# EasyEDA Pro project C8T6v1.eprj, board PCB3
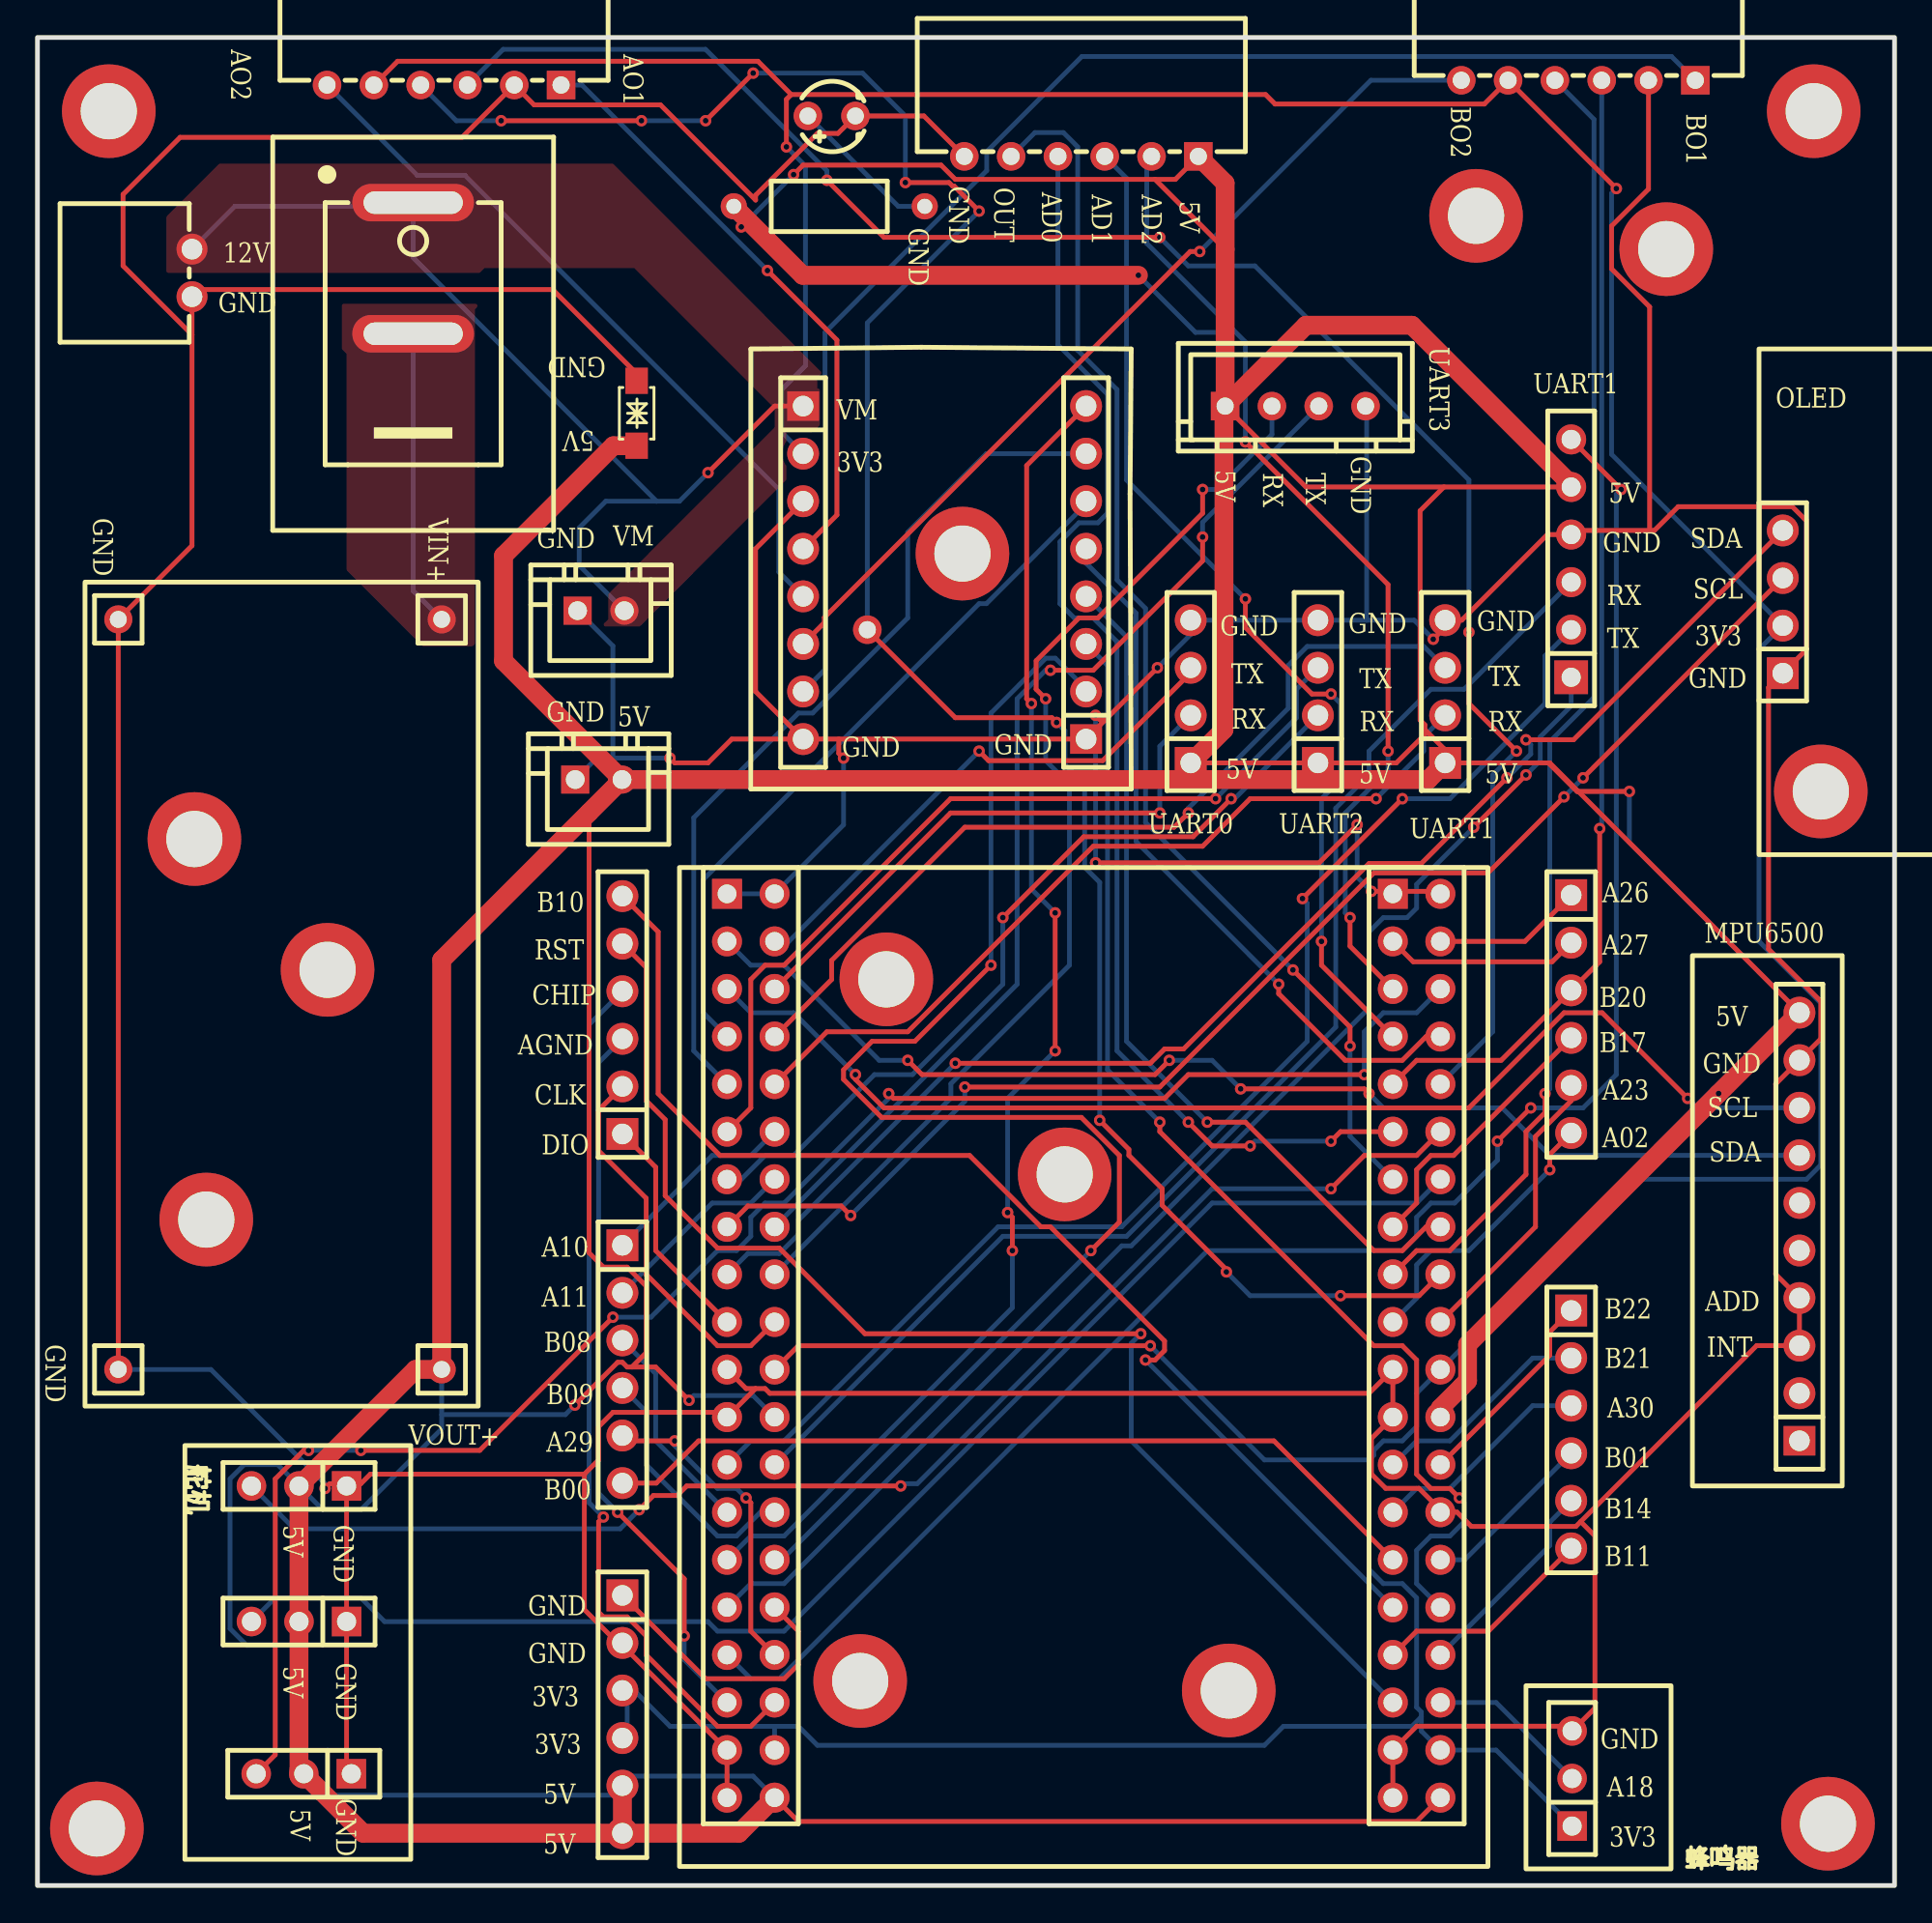
[diagram p6: board, top side]
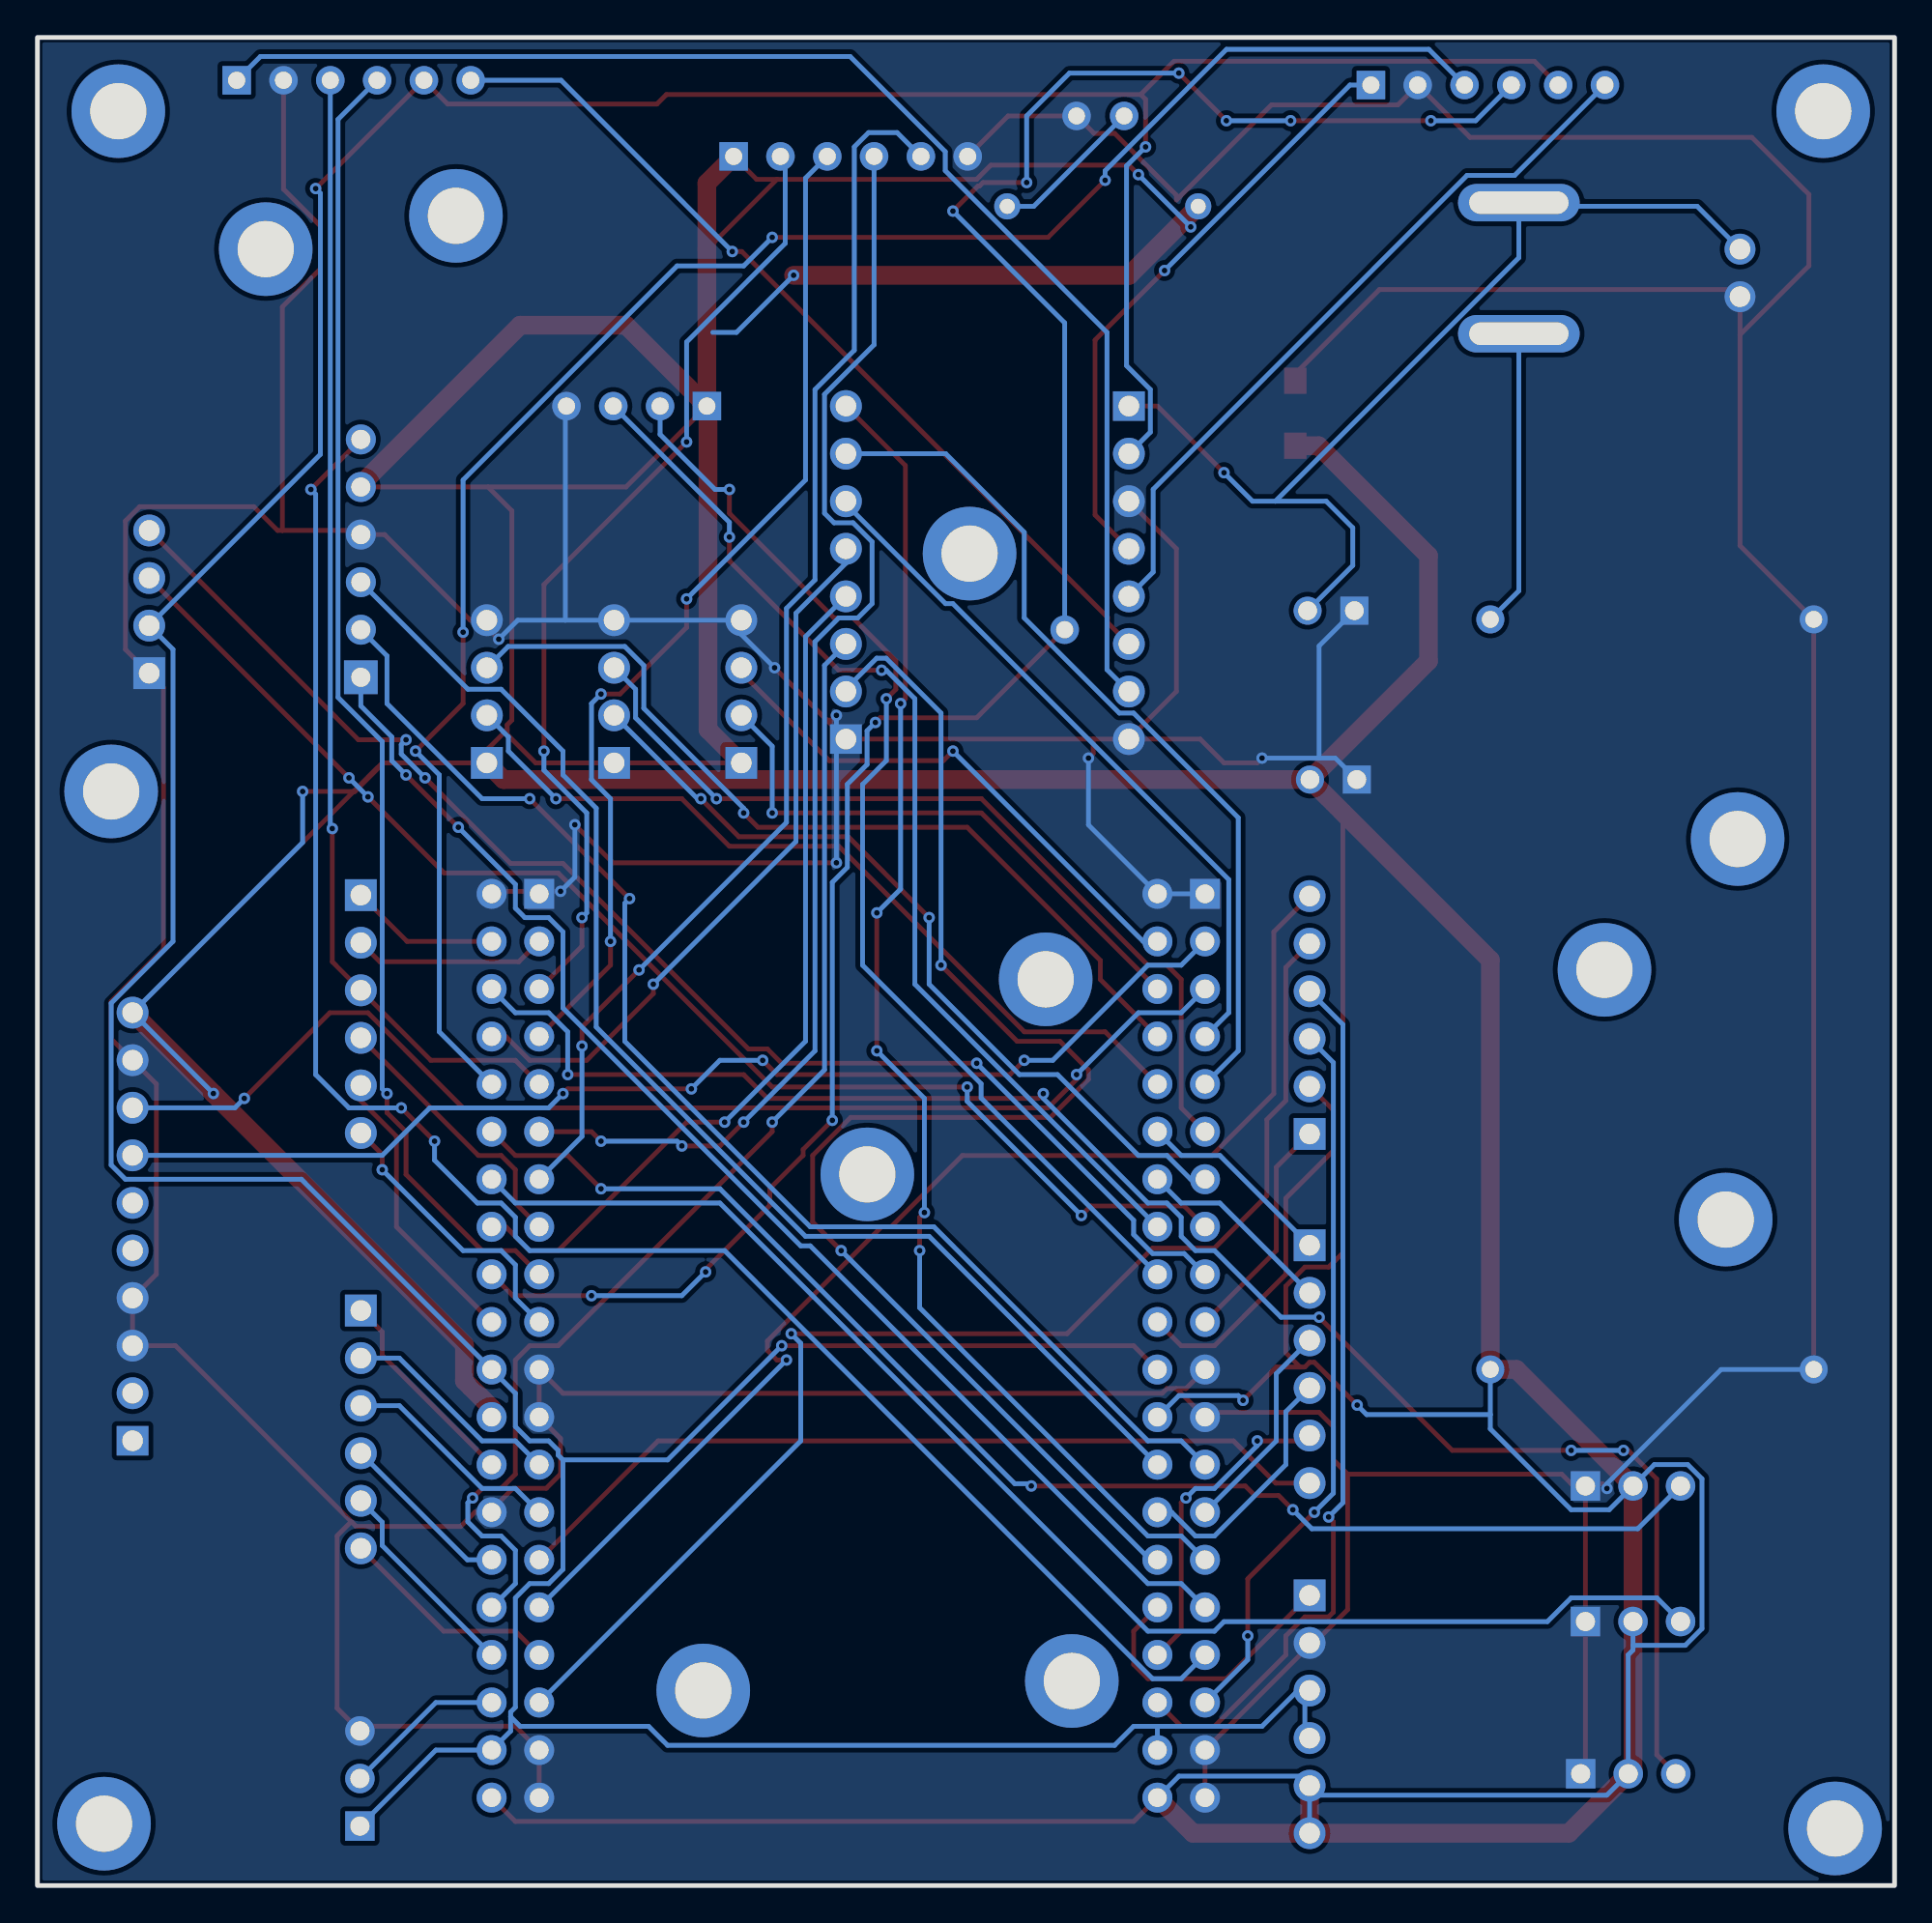
[diagram p7: board, bottom side, seen from below]

Outline 99.19 x 98.68 mm; copper layers: Top Layer, Bottom Layer. Coordinates in mm from the lower left corner of the outline.
Outline path: rectangle 0,98.68 99.19,0
Stack: Top Layer 0.035mm / Dielectric1 1.51mm FR4 er 4.5 / Bottom Layer 0.035mm

## Design rules (mm)
template: 自定义配置
spacing copperThickness1oz (default): track to track 0.102, other pairs 0.152 to 0.3
spacing copperThickness2oz: track to track 0.203, other pairs 0.152 to 0.3
track width copperThickness1oz (default): min 0.127, default 0.254, max 2.54
track width copperThickness2oz: min 0.203, default 0.254, max 2.54
differential pair differentialPair (default): width min 0.127, default 0.254, max 2.54; gap min 0.152, default 0.152
via viaSize (default): diameter min 0.5, default 0.61, max 10; hole min 0.3, default 0.305, max 6.3

## Placement (name value [footprint] x y rotation side)
CN1  WAFER-XH254Z-4AM  [CONN-TH_WAFER-XH2.54-4PZZ-H62]  67.18 78.99 0 top
CN2  HX-XH2.54-2PZZ  [CONN-TH_2P-P2.50_HX-2.54MM-2P-ZZ-MS]  29.97 59.06 0 top
CN3  HX-XH2.54-2PZZ  [CONN-TH_2P-P2.50_HX-2.54MM-2P-ZZ-MS]  30.1 68.07 0 top
D1  SMF6.0CA  [SOD-123FL_L2.7-W1.8-LS3.8-BI]  32 78.61 90 top
H1  PM254V-11-04-H85  [HDR-TH_4P-P2.54-V-F]  93.22 68.54 90 top
H2  PM254V-11-03-H85  [HDR-TH_3P-P2.54-V-F]  81.96 5.72 90 top
H3  PM254V-11-03-H85  [HDR-TH_3P-P2.54-V-F]  13.97 21.34 180 top
H4  PM254V-11-03-H85  [HDR-TH_3P-P2.54-V-F]  13.97 14.1 180 top
H5  PM254V-11-03-H85  [HDR-TH_3P-P2.54-V-F]  14.22 5.97 180 top
H8  PM254V-11-04-H85  [HDR-TH_4P-P2.54-V-F]  61.59 63.75 90 top
H9  PM254V-11-04-H85  [HDR-TH_4P-P2.54-V-F]  75.18 63.75 90 top
H13  PZ254V-11-06P  [HDR-TH_6P-P2.54-V-M]  31.24 27.84 270 top
H14  PZ254V-11-06P  [HDR-TH_6P-P2.54-V-M]  81.92 46.53 270 top
H15  PZ254V-11-06P  [HDR-TH_6P-P2.54-V-M]  81.92 24.35 270 top
H16  PM254V-11-04-H85  [HDR-TH_4P-P2.54-V-F]  68.39 63.75 90 top
H17  PZ254V-11-06P  [HDR-TH_6P-P2.54-V-M]  31.24 46.48 90 top
H18  PZ254V-11-06P  [HDR-TH_6P-P2.54-V-M]  31.24 9.14 270 top
LED1  RAD0.3  [LED-TH_BD3.8-P2.54-RD]  42.42 94.49 180 top
NOREF  -  [Pad_e245]  43.94 10.92 0 top
NOREF#2  -  [Pad_e251]  63.63 10.41 0 top
NOREF#3  -  [Pad_e247]  86.99 87.38 0 top
NOREF#4  -  [Pad_e248]  9.02 35.56 0 top
NOREF#5  -  [Pad_e238]  94.87 94.74 0 top
NOREF#6  -  [Pad_e240]  95.63 3.3 0 top
NOREF#7  -  [Pad_e8526]  44.32 67.06 0 top
NOREF#8  -  [Pad_e242]  54.86 37.97 0 top
NOREF#9  -  [Pad_e252]  15.49 48.9 0 top
NOREF#10  -  [Pad_e249]  95.25 58.42 0 top
NOREF#11  -  [Pad_e241]  45.34 48.39 0 top
NOREF#12  -  [Pad_e246]  76.83 89.15 0 top
NOREF#13  -  [Pad_e244]  49.4 71.12 0 top
NOREF#14  -  [Pad_e243]  8.38 55.88 0 top
NOREF#15  -  [Pad_e239]  3.17 3.05 0 top
NOREF#16  -  [Pad_e236]  3.81 94.74 0 top
P1  2.54-1*6P母  [HDR-TH_6P-P2.54-V-F]  81.92 70.87 90 top
R2  1kΩ  [RES-TH_BD2.7-L6.2-P10.20-D0.4]  42.29 89.66 180 top
U3  2541FV-2x20P-B  [HDR-TH_40P-P2.54-V-F-R2-C20-S2.54]  38.1 28.82 270 top
U4  2541FV-2x20P-B  [HDR-TH_40P-P2.54-V-F-R2-C20-S2.54]  73.66 28.82 270 top
U5  WAFER-XH254WZ-6A  [CONN-TH_6P-P2.50_WAFER-XH254WZ-6A]  21.72 96.14 180 top
U6  WAFER-XH254WZ-6A  [CONN-TH_6P-P2.50_WAFER-XH254WZ-6A]  82.3 96.39 180 top
U7  PM254-1-08-Z-8.5  [HDR-TH_8P-P2.54-V-F]  40.89 70.11 270 top
U8  PM254-1-08-Z-8.5  [HDR-TH_8P-P2.54-V-F]  56.01 70.11 90 top
U9  WAFER-XH254WZ-6A  [CONN-TH_6P-P2.50_WAFER-XH254WZ-6A]  55.75 92.33 180 top
U12  XH2.54-WI-2P  [CONN-TH_XH2.54-WI-2P]  8.25 86.11 90 top
U13  SS11-RBIWG-R20-R  [SW-TH_L21.0-W15.0_SS11-RBIWG-R20-R]  20.07 86.36 270 top
U19  MTBD1-D011000  [CONN-TH_MTBD1-D011000]  21.59 67.61 0 top
U20  MTBD1-D011000  [CONN-TH_MTBD1-D011000]  4.32 67.61 0 top
U21  MTBD1-D011000  [CONN-TH_MTBD1-D011000]  4.32 27.56 0 top
U22  MTBD1-D011000  [CONN-TH_MTBD1-D011000]  21.59 27.56 0 top
U23  PM2.54-1*10  [HDR-TH_10P-P2.54-V-F]  94.11 35.18 90 top

## Footprints (pads in the part's own frame, mm; a bottom-side part is the same pattern mirrored in y, then rotated)
CONN-TH_2P-P2.50_HX-2.54MM-2P-ZZ-MS
  rect 1.5x1.5 hole 1: 1(-1.25,0)
  round 1.5 hole 1: 2(1.25,0)
CONN-TH_6P-P2.50_WAFER-XH254WZ-6A
  rect 1.524x1.524 hole 0.914: 1(-6.25,0)
  round 1.524 hole 0.914: 2(-3.75,0) 3(-1.25,0) 4(1.25,0) 5(3.75,0) 6(6.25,0)
CONN-TH_MTBD1-D011000
  round 1.5 hole 0.9: 1(0,0)
CONN-TH_WAFER-XH2.54-4PZZ-H62
  rect 1.524x1.524 hole 0.914: 1(-3.75,0)
  round 1.524 hole 0.914: 2(-1.25,0) 3(1.25,0) 4(3.75,0)
CONN-TH_XH2.54-WI-2P
  round 1.65 hole 1.1: 1(-1.27,0) 2(1.27,0)
HDR-TH_3P-P2.54-V-F
  rect 1.575x1.575 hole 1.02: 1(-2.54,0)
  round 1.575 hole 1.02: 2(0,0) 3(2.54,0)
HDR-TH_4P-P2.54-V-F
  rect 1.7x1.7 hole 1.1: 1(-3.81,0)
  round 1.7 hole 1.1: 2(-1.27,0) 3(1.27,0) 4(3.81,0)
HDR-TH_6P-P2.54-V-F
  rect 1.8x1.8 hole 1.02: 1(-6.35,0)
  round 1.6 hole 1.02: 2(-3.81,0) 3(-1.27,0) 4(1.27,0) 5(3.81,0) 6(6.35,0)
HDR-TH_6P-P2.54-V-M
  rect 1.7x1.7 hole 1.1: 1(-6.35,0)
  round 1.7 hole 1.1: 2(-3.81,0) 3(-1.27,0) 4(1.27,0) 5(3.81,0) 6(6.35,0)
HDR-TH_8P-P2.54-V-F
  rect 1.575x1.7 hole 1.1: 1(-8.89,0)
  round 1.7 hole 1.1: 2(-6.35,0) 3(-3.81,0) 4(-1.27,0) 5(1.27,0) 6(3.81,0) 7(6.35,0) 8(8.89,0)
HDR-TH_10P-P2.54-V-F
  rect 1.575x1.7 hole 1.1: 1(-11.43,0)
  round 1.7 hole 1.1: 2(-8.89,0) 3(-6.35,0) 4(-3.81,0) 5(-1.27,0) 6(1.27,0) 7(3.81,0) 8(6.35,0) 9(8.89,0) 10(11.43,0)
HDR-TH_40P-P2.54-V-F-R2-C20-S2.54
  rect 1.6x1.6 hole 1: 1(-24.13,-1.27)
  round 1.6 hole 1: 2(-24.13,1.27) 3(-21.59,-1.27) 4(-21.59,1.27) 5(-19.05,-1.27) 6(-19.05,1.27) 7(-16.51,-1.27) 8(-16.51,1.27) 9(-13.97,-1.27) 10(-13.97,1.27) 11(-11.43,-1.27) 12(-11.43,1.27) 13(-8.89,-1.27) 14(-8.89,1.27) 15(-6.35,-1.27) 16(-6.35,1.27) 17(-3.81,-1.27) 18(-3.81,1.27) 19(-1.27,-1.27) 20(-1.27,1.27) 21(1.27,-1.27) 22(1.27,1.27) 23(3.81,-1.27) 24(3.81,1.27) 25(6.35,-1.27) 26(6.35,1.27) 27(8.89,-1.27) 28(8.89,1.27) 29(11.43,-1.27) 30(11.43,1.27) 31(13.97,-1.27) 32(13.97,1.27) 33(16.51,-1.27) 34(16.51,1.27) 35(19.05,-1.27) 36(19.05,1.27) 37(21.59,-1.27) 38(21.59,1.27) 39(24.13,-1.27) 40(24.13,1.27)
LED-TH_BD3.8-P2.54-RD
  round 1.524 hole 0.9: 1(-1.27,0) 2(1.27,0)
Pad_e236
  round 5 hole 3: 1(0,0)
Pad_e238
  round 5 hole 3: 1(0,0)
Pad_e239
  round 5 hole 3: 1(0,0)
Pad_e240
  round 5 hole 3: 1(0,0)
Pad_e241
  round 5 hole 3: 1(0,0)
Pad_e242
  round 5 hole 3: 1(0,0)
Pad_e243
  round 5 hole 3: 1(0,0)
Pad_e244
  round 5 hole 3: 1(0,0)
Pad_e245
  round 5 hole 3: 1(0,0)
Pad_e246
  round 5 hole 3: 1(0,0)
Pad_e247
  round 5 hole 3: 1(0,0)
Pad_e248
  round 5 hole 3: 1(0,0)
Pad_e249
  round 5 hole 3: 1(0,0)
Pad_e251
  round 5 hole 3: 1(0,0)
Pad_e252
  round 5 hole 3: 1(0,0)
Pad_e8526
  round 1.524 hole 0.914: 1(0,0)
RES-TH_BD2.7-L6.2-P10.20-D0.4
  round 1.4 hole 0.8: 1(-5.1,0) 2(5.1,0)
SOD-123FL_L2.7-W1.8-LS3.8-BI
  rect 1.4x1.2 smd: 1(-1.735,0) 2(1.735,0)
SW-TH_L21.0-W15.0_SS11-RBIWG-R20-R
  oval 2x6.5 hole 1.2x5.3: 1(-3.5,0) 2(3.5,0)

## Nets
As in the schematic, except:
A21: NOREF#7.1 U4.18 U5.4

Pads without a net: NOREF 1; NOREF#2 1; NOREF#3 1; NOREF#4 1; NOREF#5 1; NOREF#6 1; NOREF#8 1; NOREF#9 1; NOREF#10 1; NOREF#11 1; NOREF#12 1; NOREF#13 1; NOREF#14 1; NOREF#15 1; NOREF#16 1; U23 1 2 5 6

## Via types
v1: diameter 0.61, hole 0.305, Top Layer to Bottom Layer, 107 vias

## Routing (per net, layer and track width the routed paths; a pad name or vN(x,y) marks a point on that pad's centre or on a via; arc(x,y) is an arc through that point)
3V3: length 290.7
  Top Layer w0.254: 40.26,95.63 38.48,97.41 19.24,97.41 U5.5 ; 40.26,95.63 65.59,95.63 66.1,95.12 77.28,95.12 U6.5 v1(84.33,90.61) ; 40.26,95.63 40,95.37 v1(40,92.84) ; v1(59.44,28.82) 40.64,28.82 U3.22
  Bottom Layer w0.254: H2.1 77.91,7.23 U4.38 73.91,8.25 73.91,9.01 ; 71.12,22.73 71.37,22.98 71.37,23.24 71.88,23.74 72.9,23.74 73.66,24.51 73.66,26.28 U4.22 85.09,37.71 94.49,37.71 95.25,38.48 95.25,47.11 91.95,50.41 91.95,66 H1.2 84.07,76.42 84.07,90.36 v1(84.33,90.61) ; 71.12,22.73 71.12,16.89 71.88,16.12 72.9,16.12 73.66,15.36 73.66,9.52 73.91,9.27 73.91,9.01 ; 71.12,22.73 65.53,22.73 v1(59.44,28.82) ; 73.91,9.01 73.41,8.5 66.55,8.5 65.53,7.49 41.66,7.49 40.64,8.5 39.37,8.5 ; H18.4 31.5,8.13 31.5,10.28 ; H18.3 31.37,10.28 31.5,10.28 ; 39.37,8.5 U3.38 ; 39.37,8.5 33.78,8.5 32,10.28 31.5,10.28 ; U7.2 39.75,77.6 39.75,79.88 41.02,81.15 41.02,91.82 v1(40,92.84)
5V: length 564.9
  Top Layer w0.254: 59.69,91.1 60.78,91.1 U9.1 ; 59.69,91.1 49.02,91.1 48.26,91.86 40.89,91.86 v1(40.39,91.36) ; 59.69,91.1 63.43,87.36 ; 80.7,59.94 82.23,58.42 82.3,58.42 ; 80.7,59.94 75.37,59.94 ; 80.7,59.94 80.77,59.94 82.3,58.42 ; v1(28.7,25.65) 30.99,27.94 31.24,27.94 31.5,27.69 31.75,27.69 ; 74.1,61.72 74.1,61.47 72.58,59.94 61.59,59.94 ; 74.1,61.72 74.1,61.98 73.85,62.23 73.85,73.41 75.12,74.68 ; 74.1,61.72 75.12,60.71 75.12,60.2 ; 82.3,58.42 v1(85.02,58.42) ; 82.3,58.42 U23.10 ; 31.75,27.69 33.02,27.69 v1(34.8,25.91) ; 31.75,27.69 32.51,28.45 32.51,32 31.5,33.02 30.23,33.02 29.46,33.78 29.46,57.3 ; 75.12,74.68 P1.5 ; 75.12,74.68 67.75,74.68 CN1.1 ; 75.12,60.2 75.37,59.94 ; 75.12,60.2 75.12,60.01 75.18,59.94 75.37,59.94 ; U3.40 40.64,3.42 73.66,3.42 U4.40 ; 76.07,26.64 76.07,26.16 ; 76.38,28.88 76.07,28.58
  Top Layer w1: H18.6 H18.5 ; H18.6 17.4,2.79 H5.2 13.97,6.22 H4.2 H3.2 20.19,27.56 U22.1 21.59,49.42 CN2.2 ; H18.6 37.47,2.79 U3.40 ; v1(58.8,85.98) 40.87,85.98 R2.2 ; D1.1 30.76,76.88 24.89,71.01 24.89,65.39 CN2.2 ; U4.24 74.93,25.5 76.38,26.95 76.38,28.88 v1(89.79,42.29) U23.10 ; U9.1 63.43,90.9 CN1.1 ; CN2.2 74.3,59.06 75.18,59.94 ; 61.59,59.94 63.37,61.72 63.37,78.93 CN1.1 ; CN1.1 67.75,83.31 73.41,83.31 81.92,74.8 P1.5
  Bottom Layer w0.254: U3.24 38.22,26.16 35.05,26.16 v1(34.8,25.91) ; v1(28.7,25.65) 28.19,25.15 21.59,25.15 ; v1(89.79,42.29) U23.10 85.02,55.69 v1(85.02,58.42) ; 21.59,25.15 U22.1 ; 21.59,25.15 21.59,24.38 17.27,20.07 15.24,20.07 H3.2 12.83,22.48 11.05,22.48 10.29,21.72 10.29,13.72 11.18,12.83 13.97,12.83 ; H18.5 30.73,4.83 15.37,4.83 H5.2 14.22,12.32 13.97,12.57 13.97,12.83 ; H18.5 31.75,5.84 38.22,5.84 U3.40 ; H18.5 H18.6 ; v1(37.59,88.56) v1(40.39,91.36) ; 63.12,82.93 61.85,82.93 v1(58.8,85.98) ; 13.97,12.83 H4.2
12V: length 54.2
  Top Layer w0.254: U7.1 39.37,79 v1(35.81,75.44)
  Bottom Layer w0.254: 20.07,89.66 10.54,89.66 U12.2 ; 20.07,89.66 20.07,86.92 33.07,73.92 ; 20.07,89.66 U13.1 ; 33.07,73.92 30.36,73.92 28.94,72.5 28.94,70.49 CN3.2 ; 33.07,73.92 34.29,73.92 v1(35.81,75.44)
AGND: length 38.8
  Top Layer w0.254: v1(34.54,13.33) 34.54,16.38 v1(30.99,19.93)
  Bottom Layer w0.254: v1(30.99,19.93) 29.97,20.95 29.97,43.94 H17.3 ; v1(34.54,13.33) 34.54,12.06 U3.35
GND: length 544.5
  Top Layer w0.254: 29.21,21.97 17.78,21.97 17.27,21.46 16.63,21.46 ; 29.21,21.97 29.21,14.73 30.99,12.95 H18.2 31.24,12.82 U3.37 U3.39 ; 29.21,21.97 29.97,22.73 29.97,24.51 30.73,25.27 36.58,25.27 U3.23 38.35,26.54 ; v1(56.52,54.61) 68.45,54.61 v1(70.48,56.64) ; 75.06,19.94 75.82,19.94 76.58,19.18 82.17,19.18 82.42,19.43 ; 75.06,19.94 U4.28 ; 75.06,19.94 73.79,21.21 72.01,21.21 71.25,21.97 71.25,23.87 U4.23 U4.21 71.12,26.28 39.12,26.28 38.86,26.54 38.35,26.54 ; 86.11,72.35 86.36,72.35 87.63,73.62 93.73,73.62 94.49,72.86 94.49,66 H1.1 92.46,63.97 92.46,50 95.25,47.21 95.25,45.21 U23.9 92.84,42.8 92.84,32.64 U23.4 U23.3 91.82,28.83 82.42,19.43 ; 86.11,72.35 86.11,84.29 84.07,86.32 84.07,88.61 86.05,90.58 U6.2 ; 86.11,72.35 82.13,72.35 P1.4 80.64,72.14 76.07,67.56 75.31,67.56 ; 75.31,67.56 75.31,67.31 v1(74.55,66.55) ; 75.31,67.56 H9.4 ; 42.8,61.22 42.8,60.45 v1(43.05,60.2) ; 42.8,61.22 U8.1 ; 42.8,61.22 U7.8 ; U7.8 38.35,63.76 38.35,71.38 U7.3 ; U7.8 37.08,61.22 35.81,59.95 34.04,59.95 v1(33.78,60.2) ; 8.25,82.8 8.25,71.54 U20.1 U21.1 ; 8.25,82.8 U12.1 8.64,85.22 27.52,85.22 32,80.73 D1.2 ; 8.25,82.8 4.57,86.49 4.57,90.3 7.62,93.35 22.67,93.35 U5.2 26.53,95.08 33.27,95.08 38.35,90 38.35,90.25 41.66,93.56 42.76,93.56 LED1.1 47.34,94.49 U9.6 ; U4.2 74.8,53.09 72.52,53.09 ; 16.63,21.46 16.51,21.34 16.51,6.22 H5.1 ; 16.63,21.46 15.61,21.46 v1(15.36,21.2) ; 57.02,62.23 56.01,61.22 ; 57.02,62.23 v1(59.82,65.02) ; 57.02,62.23 56.77,62.23 v1(56.52,62.48) ; 82.42,19.43 83.18,18.67 83.18,9.48 H2.3 81.71,8.51 73.67,8.51 U4.37 U4.39 ; 38.35,26.54 37.85,26.54 U3.21 ; 72.52,53.09 U4.1 ; 72.52,53.09 v1(71.25,53.09)
  Bottom Layer w0.254: v1(74.55,66.55) 73.53,67.56 70.99,67.56 ; 30.73,60.2 30.73,66.19 CN3.1 ; 30.73,60.2 29.87,60.2 CN2.1 ; 30.73,60.2 v1(33.78,60.2) ; 4.32,27.55 9.26,27.55 15.36,21.46 v1(15.36,21.2) ; v1(59.82,65.02) 61.59,66.8 H8.4 H16.4 70.99,67.56 ; v1(71.25,53.09) 70.48,53.85 v1(70.48,56.64) ; v1(43.05,60.2) 43.05,56.64 U3.2 U3.1 ; 70.99,67.56 70.99,78.93 CN1.4 ; v1(56.52,62.48) v1(56.52,54.61)
A00: length 62.6
  Top Layer w0.254: v1(60.45,44.06) 59.69,43.3 47.24,43.3 v1(46.48,44.06) ; v1(71.12,42.29) 70.87,42.54 v1(64.26,42.54)
  Bottom Layer w0.254: U3.3 38.1,49.14 39.88,49.14 44.96,44.06 v1(46.48,44.06) ; v1(60.45,44.06) 62.74,44.06 v1(64.26,42.54) ; v1(71.12,42.29) 71.88,41.52 78.23,41.52 80.77,38.99 U23.7
A01: length 64.3
  Top Layer w0.254: v1(43.69,43.3) 43.69,43.05 45.21,41.52 76.45,41.52 81.53,46.6 83.57,46.6 v1(88.14,42.03)
  Bottom Layer w0.254: U23.8 88.64,41.53 v1(88.14,42.03) ; U3.5 38.1,46.6 40.39,46.6 v1(43.69,43.3)
A02: length 15.2
  Top Layer w0.254: H14.6 80.77,39.04 v1(80.77,38.22)
  Bottom Layer w0.254: v1(80.77,38.22) 76.45,33.9 74.42,33.9 73.66,33.14 73.66,31.36 U4.19
A07: length 63.5
  Top Layer w0.254: v1(75.95,20.7) 75.44,21.2 74.42,21.2 73.66,21.97 73.66,28.06 72.9,28.82 71.37,28.82 59.94,40.25 v1(59.94,40.76)
  Bottom Layer w0.254: v1(75.95,20.7) 76.2,20.44 76.2,19.43 75.44,18.66 74.42,18.66 73.66,17.9 73.66,16.12 U4.32 ; v1(59.94,40.76) 57.15,43.56 57.15,65.15 U8.3
A08: length 37.8
  Bottom Layer w0.254: U8.6 56.01,73.77 50.68,68.45 50.29,68.45 35.56,53.72 35.56,46.6 U3.7
A09: length 46.6
  Bottom Layer w0.254: U3.9 35.05,44.57 35.05,57.02 40.64,62.61 41.4,62.61 46.48,67.69 46.48,72.26 50.68,76.46 U8.7
A10: length 10.6
  Bottom Layer w0.254: H13.1 36.04,38.98 38.1,38.98 U3.12
A11: length 10.6
  Bottom Layer w0.254: H13.2 36.04,36.44 38.1,36.44 U3.14
A12: length 72.1
  Top Layer w0.254: v1(52.07,33.9) 52.07,35.68 v1(51.82,35.94) ; U8.8 52.83,75.82 52.83,63.37 v1(53.09,63.11) ; v1(54.36,44.57) v1(54.36,51.94)
  Bottom Layer w0.254: v1(53.09,63.11) 53.09,53.21 v1(54.36,51.94) ; v1(52.07,33.9) 52.07,30.86 39.88,18.66 38.1,18.66 U3.29 ; v1(51.82,35.94) 51.82,42.03 v1(54.36,44.57)
A13: length 77.1
  Top Layer w0.254: v1(56.26,33.9) 57.78,35.43 57.78,38.98 55.75,41.02 45.08,41.02 43.05,43.05 43.05,43.56 44.58,45.08 46.86,45.08 v1(50.93,49.14)
  Bottom Layer w0.254: U3.30 39.75,17.39 v1(56.26,33.9) ; U8.2 55.89,63.88 55.89,64.01 54.36,65.53 53.86,65.53 50.93,62.61 v1(50.93,49.14)
A14: length 69.5
  Top Layer w0.254: U4.11 69.6,40.25 v1(69.09,39.75) ; v1(61.47,40.76) 62.74,39.49 v1(64.77,39.49)
  Bottom Layer w0.254: U9.4 54.5,82.27 57.15,79.62 57.15,73.27 56.64,72.77 55.63,72.77 54.61,71.75 54.61,68.45 55.37,67.69 56.39,67.69 57.66,66.42 57.66,44.57 v1(61.47,40.76) ; v1(64.77,39.49) 65.02,39.75 v1(69.09,39.75)
A15: length 73.2
  Top Layer w0.254: v1(69.09,37.21) 70.87,38.98 73.66,38.98 U4.12 ; v1(32.14,20.07) 32.9,20.83 34.17,20.83 34.68,21.34 v1(46.11,21.34)
  Bottom Layer w0.254: v1(46.11,21.34) 46.23,21.46 46.99,21.46 62.74,37.21 v1(69.09,37.21) ; H3.3 13.72,19.05 31.12,19.05 v1(32.14,20.07)
A16: length 66.5
  Top Layer w0.254: v1(67.06,48.89) 70.1,45.84 v1(70.1,44.83)
  Bottom Layer w0.254: v1(70.1,44.83) 70.1,40 U4.13 ; U9.5 53.27,93.6 54.8,93.6 55.56,92.84 55.56,81.98 57.66,79.88 57.66,69.72 59.18,68.19 59.18,56.76 v1(67.06,48.89)
A17: length 74.8
  Bottom Layer w0.254: H4.3 12.69,15.36 17.27,15.36 18.54,14.09 35.81,14.09 36.32,13.58 39.88,13.58 62.74,36.44 73.66,36.44 U4.14
A18: length 8.7
  Bottom Layer w0.254: U4.36 77.91,9.77 H2.2
A21: length 119.3
  Top Layer w0.254: v1(54.43,62.1) 54.18,62.36 49.02,62.36 NOREF#7.1 ; v1(69.6,31.5) 73.79,31.5 U4.18 ; v1(63.5,32.77) 63.5,32.89 60.07,36.32 60.07,37.21 58.29,38.99 58.29,39.3 v1(56.73,40.86) ; v1(38.23,96.77) v1(35.69,94.23) ; v1(46.36,90.93) 48.69,90.93 48.87,90.75 48.95,90.75 v1(50.29,89.41) ; v1(32.26,94.23) v1(24.76,94.23)
  Bottom Layer w0.254: v1(63.5,32.77) 64.77,31.5 v1(69.6,31.5) ; v1(35.69,94.23) v1(32.26,94.23) ; v1(38.23,96.77) 44.07,96.77 46.36,94.49 v1(46.36,90.93) ; NOREF#7.1 44.32,83.44 v1(50.29,89.41) ; v1(24.76,94.23) 22.37,94.23 U5.4 ; v1(54.43,62.1) 54.88,61.66 54.88,59.86 55.93,58.8 55.93,54.37 56.73,53.56 v1(56.73,40.86)
A22: length 99.1
  Top Layer w0.254: v1(76.45,66.92) 76.45,63.11 v1(78.99,60.57) ; v1(59.94,88.01) 45.21,88.01 v1(42.16,91.05)
  Bottom Layer w0.254: v1(78.99,60.57) 77.72,59.3 77.72,45.59 U4.10 ; v1(76.45,66.92) 76.45,75.05 65.02,86.48 61.47,86.48 v1(59.94,88.01) ; U5.3 24.87,98.04 35.68,98.04 42.16,91.56 v1(42.16,91.05)
A23: length 15.5
  Top Layer w0.254: H14.5 81.92,41.9 80.01,40 80.01,35.17 U4.20
A24: length 91.5
  Top Layer w0.254: v1(30.73,30.35) 23.62,23.24 v1(17.27,23.24) ; v1(14.48,23.24) 14.22,23.24 12.7,21.71 12.7,6.99 11.68,5.97 ; v1(45.47,42.29) 45.72,42.03 60.2,42.03 61.47,43.3 v1(70.87,43.3)
  Bottom Layer w0.254: v1(17.27,23.24) v1(14.48,23.24) ; v1(70.87,43.3) 70.87,45.59 71.88,46.6 73.66,46.6 U4.6 ; v1(30.73,30.35) 32.77,30.35 36.32,33.9 37.34,33.9 38.1,34.67 38.1,35.68 38.86,36.44 39.88,36.44 45.47,42.03 v1(45.47,42.29)
A25: length 51.9
  Top Layer w0.254: v1(72.14,60.57) 72.14,69.46 v1(64.52,77.08) ; v1(70.1,51.68) 70.1,50.16 U4.5
  Bottom Layer w0.254: v1(64.52,77.08) 64.52,82.42 59.25,87.68 59.25,92.08 U9.2 ; v1(70.1,51.68) 69.85,51.94 69.85,57.27 72.14,59.56 v1(72.14,60.57)
A26: length 8
  Top Layer w0.254: H14.1 79.45,50.41 U4.4
A27: length 10.4
  Top Layer w0.254: H14.2 80.9,49.33 73.48,49.33 U4.3
A28: length 28.9
  Top Layer w0.254: v1(50.29,60.57) 50.8,60.07 56.9,60.07 61.59,64.76 61.59,65.02
  Bottom Layer w0.254: U3.4 40.13,50.41 v1(50.29,60.57)
A29: length 17.1
  Top Layer w0.254: v1(34.04,23.74) 31.53,23.74 H13.5 ; U3.34 38.1,13.58 38.1,20.44 v1(37.85,20.7)
  Bottom Layer w0.254: v1(34.04,23.74) 34.04,23.49 36.32,21.2 37.34,21.2 v1(37.85,20.7)
A30: length 11.9
  Bottom Layer w0.254: H15.3 79.86,25.62 75.44,21.2 73.66,21.2 U4.27
A31: length 30.4
  Top Layer w0.254: v1(59.94,57.27) 48.77,57.27 U3.6
  Bottom Layer w0.254: v1(59.94,57.27) 59.94,60.83 H8.2
AO1: length 32.3
  Top Layer w0.254: v1(38.99,86.23) 42.7,82.52 42.7,73.18 U7.4
  Bottom Layer w0.254: U5.1 29.08,96.14 v1(38.99,86.23)
AO2: length 39.3
  Bottom Layer w0.254: U5.6 20.29,91.31 22.83,91.31 39.6,74.55 39.6,70.13 U7.5
B00: length 44.7
  Top Layer w0.254: H13.6 33.05,21.49 35.31,23.74 66.04,23.74 U4.29
B01: length 9.3
  Bottom Layer w0.254: U4.30 76.22,17.39 H15.4
B02: length 71.6
  Top Layer w0.254: H1.3 v1(82.55,59.15) ; U3.15 37.94,36.29 42.93,36.29 v1(43.43,35.78) ; v1(81.53,58.13) 77.47,54.07 71.37,54.07 59.94,42.64 v1(49.53,42.64)
  Bottom Layer w0.254: v1(49.53,42.64) 49.53,41.87 v1(43.43,35.78) ; v1(82.55,59.15) v1(81.53,58.13)
B03: length 74.1
  Top Layer w0.254: v1(78.49,59.15) 73.91,54.57 71.12,54.57 61.21,44.67 60.2,44.67 59.44,43.91 v1(49.02,43.91) ; H1.4 82.04,61.18 v1(79.5,61.18)
  Bottom Layer w0.254: U3.17 37.94,33.75 39.62,33.75 40.64,34.76 40.64,35.52 v1(49.02,43.91) ; v1(79.5,61.18) 79.76,60.92 79.76,60.42 v1(78.49,59.15)
B04: length 47
  Top Layer w0.254: U3.8 42.42,48.38 42.42,49.4 49.53,56.51 60.71,56.51 v1(61.47,57.27)
  Bottom Layer w0.254: v1(61.47,57.27) 61.47,57.53 66.8,62.86 66.8,65.15 67.82,66.16 74.05,66.16 75.18,65.02
B05: length 44.4
  Top Layer w0.254: v1(71.49,58.03) 64.77,58.03 62.23,55.49 56.39,55.49 46.48,45.59 42.16,45.59 U3.10
  Bottom Layer w0.254: v1(71.49,58.03) 74.03,60.57 74.03,61.34 H9.2
B06: length 69.9
  Top Layer w0.254: v1(67.56,52.7) v1(72.9,58.03)
  Bottom Layer w0.254: P1.2 80.52,65.66 80.52,63.11 75.44,58.03 v1(72.9,58.03) ; U3.25 38.1,23.74 39.88,23.74 51.31,35.17 57.91,35.17 67.82,45.08 67.82,52.45 v1(67.56,52.7)
B07: length 69.7
  Bottom Layer w0.254: P1.3 76.19,63.88 74.42,63.88 71.12,60.57 71.12,59.3 69.34,57.53 69.34,45.84 58.17,34.67 51.56,34.67 U3.26
B08: length 11.5
  Bottom Layer w0.254: H13.3 33.02,27.33 33.02,23.74 U3.27
B09: length 13.6
  Bottom Layer w0.254: H13.4 32.51,25.3 32.51,22.47 36.32,18.66 37.34,18.66 38.61,19.93 U3.28
B10: length 64.3
  Top Layer w0.254: v1(59.18,28.06) 59.69,28.06 60.2,28.57 60.2,29.08 54.1,35.17 53.59,35.17 49.78,38.98 36.45,38.98 33.15,42.29 33.15,50.92 H17.6
  Bottom Layer w0.254: U4.31 v1(59.18,28.06)
B11: length 11.9
  Top Layer w0.254: H15.6 77.49,13.58 73.66,13.58 U4.33
B12: length 57.3
  Top Layer w0.254: v1(62.23,72) 62.23,70.73 56.39,64.89 v1(54.1,64.89)
  Bottom Layer w0.254: v1(62.23,72) 62.23,72.79 CN1.3 ; U3.16 52.32,48.13 52.32,63.37 53.85,64.89 v1(54.1,64.89)
B13: length 59.9
  Top Layer w0.254: v1(62.23,74.54) 62.23,73.27 56.64,67.69 55.63,67.69 53.34,65.4 53.34,63.88 v1(53.85,63.37)
  Bottom Layer w0.254: U3.18 48.79,42.05 48.79,42.81 55.12,49.14 55.12,58.8 53.85,60.07 v1(53.85,63.37) ; CN1.2 65.93,77.48 62.99,74.54 v1(62.23,74.54)
B14: length 11.1
  Bottom Layer w0.254: U4.34 80.77,18.16 80.77,19.4 H15.5
B15: length 46.7
  Top Layer w0.254: v1(62.92,58.03) 48.77,58.03 39.88,49.14 38.86,49.14 38.1,48.38 38.1,41.52 U3.11
  Bottom Layer w0.254: v1(62.92,58.03) 67.24,62.35 67.24,63.88 68.39,65.02
B16: length 43.9
  Top Layer w0.254: v1(63.75,58.03) 61.72,56 55.88,56 v1(51.56,51.68)
  Bottom Layer w0.254: v1(51.56,51.68) 51.56,48.13 46.74,43.3 44.7,43.3 40.39,38.98 38.86,38.98 37.59,37.71 U3.13 ; v1(63.75,58.03) 63.94,58.03 H16.2
B17: length 14.7
  Top Layer w0.254: H14.4 75.64,38.98 74.42,38.98 73.66,38.22 73.66,36.44 U4.15
B18: length 46.6
  Top Layer w0.254: U4.16 74.17,35.17 72.9,33.9 71.37,33.9 64.52,40.76 v1(62.48,40.76)
  Bottom Layer w0.254: v1(62.48,40.76) 58.17,45.08 58.17,66.68 U8.4
B19: length 70.1
  Top Layer w0.254: U4.17 73.66,33.9 75.44,33.9 79.5,37.97 79.5,40.25 80.52,41.27 v1(80.52,42.29)
  Bottom Layer w0.254: v1(80.52,42.29) 80.77,42.54 80.77,61.08 83.13,63.44 83.13,94.31 U6.4
B20: length 60.9
  Top Layer w0.254: v1(83.44,56.44) 83.44,49.33 H14.3 78.18,44.06 73.66,44.06 U4.9
  Bottom Layer w0.254: v1(83.44,56.44) 83.55,56.55 U6.3
B21: length 11.9
  Bottom Layer w0.254: U4.25 73.66,23.74 75.44,23.74 79.86,28.16 H15.2
B22: length 11.1
  Top Layer w0.254: U4.26 80.77,28.31 80.77,29.56 H15.1
B23: length 70.4
  Top Layer w0.254: v1(76.71,56.51) v1(79.5,59.3)
  Bottom Layer w0.254: v1(76.71,56.51) 73.66,53.46 73.66,52.19 73.15,51.68 71.88,51.68 71.12,50.92 71.12,46.86 58.42,34.16 57.91,34.16 39.88,16.12 38.1,16.12 U3.31 ; v1(79.5,59.3) 80.26,60.07 80.26,61.34 81.92,62.99 P1.1
B24: length 38.7
  Top Layer w0.254: U4.8 74.17,45.33 72.9,44.06 69.85,44.06 66.29,47.62 v1(66.29,48.13)
  Bottom Layer w0.254: v1(66.29,48.13) 58.67,55.75 58.67,67.94 56.01,70.61 U8.5
B25: length 54.8
  Top Layer w0.254: v1(64.52,68.7) 64.52,67.18 68.07,63.62 v1(69.09,63.62) ; U4.7 68.58,49.14 v1(68.58,50.41)
  Bottom Layer w0.254: v1(68.58,50.41) 68.58,58.03 69.6,59.05 69.6,63.11 v1(69.09,63.62) ; U9.3 58.17,91.17 58.17,75.05 v1(64.52,68.7)
B26: length 15.1
  Top Layer w0.254: H18.1 35.69,11.04 39.88,11.04 40.64,11.81 40.64,13.58 U3.32
B27: length 97.7
  Top Layer w0.254: v1(84.58,74.54) P1.6 ; v1(77.98,39.75) v1(79.76,41.52)
  Bottom Layer w0.254: v1(84.58,74.54) 84.33,74.29 84.33,43.3 82.55,41.52 v1(79.76,41.52) ; v1(77.98,39.75) 77.98,38.73 75.69,36.44 74.42,36.44 73.66,35.68 73.66,34.67 72.9,33.9 62.49,33.9 39.63,11.04 38.1,11.04 U3.33
BO1: length 73.4
  Bottom Layer w0.254: U7.7 42.06,64.93 42.06,82.93 50.7,91.57 50.7,92.58 55.78,97.66 87.28,97.66 U6.1
BO2: length 47.8
  Top Layer w0.254: U7.6 42.03,67.43 42.03,67.71 61.57,87.25 v1(62.08,87.25)
  Bottom Layer w0.254: U6.6 71.22,96.39 v1(62.08,87.25)
CHIP: length 47.4
  Top Layer w0.254: v1(30.23,19.68) 29.97,19.43 29.97,14.6 30.23,14.34 31.5,14.34 32.51,13.33 32.51,12.31 36.32,8.5 38.1,8.5 U3.36
  Bottom Layer w0.254: v1(30.23,19.68) 29.46,20.44 29.46,45.97 H17.4
CLK: length 20.6
  Top Layer w0.254: H17.2 29.97,41.4 29.97,39.24 32.51,36.7 32.51,32.63 36.32,28.82 38.1,28.82 U3.20
DIO: length 12.4
  Top Layer w0.254: U3.19 33.02,33.9 33.02,38.35 H17.1
POWER: length 15.9
  Bottom Layer w0.254: U13.2 20.07,69.13 U19.1
RST: length 68.5
  Top Layer w0.254: v1(58.93,29.46) 44.2,29.46 39.62,34.04 36.32,34.04 33.53,36.83 33.53,40.89 32.51,41.91 32.51,49.02 H17.5
  Bottom Layer w0.254: U4.35 58.42,23.74 58.42,28.96 v1(58.93,29.46)
$1N3633: length 8.2
  Bottom Layer w0.254: LED1.2 45.97,89.66 R2.1

## Copper pours and planes (outline as drawn; the poured copper is in the pictures)
12V on Top Layer: 23.24,86.36 31.88,86.36 40,78.23 41.4,78.23 41.66,77.98 41.66,80.52 41.91,80.77 30.73,91.95 23.49,91.95 23.24,91.69
12V on Top Layer: 6.89,89.11 6.89,86.11 23.62,86.11 23.88,86.36 23.88,91.57 23.49,91.95 9.72,91.95
12V on Top Layer: 40,75.06 40,78.11 39.62,78.11 30.48,68.96 30.48,67.61 30.1,67.23 32.18,67.23
12V on Top Layer: 39.37,79.88 39.37,77.6 41.4,77.6 41.78,77.98 41.78,79.94 39.43,79.94
12V on Top Layer: 41.66,78.11 40,78.11 40,79.88 41.78,79.88 41.78,78.23
GND on Top Layer: -8.76,50.55 122.43,50.55 122.43,-77.6 -8.76,-77.6
GND on Bottom Layer: -64.14,109.09 173.48,109.09 173.48,-9.02 -64.14,-9.02
POWER on Top Layer: 16.26,84.46 16.26,82.04 16.51,81.79 16.51,70.23 20.57,66.17 23.24,66.17 23.37,66.29 23.37,84.17 23.55,84.35 23.44,84.46

## Text on the board
Top Silkscreen Layer: GND | 12V | VOUT+ | AGND | CHIP | 3V3 | RST | CLK | B10 | DIO | A10 | A11 | 5V | B08 | B00 | B09 | A29 | VM | UART0 | TX | RX | UART2 | UART1 | B20 | B17 | A26 | A27 | A23 | A02 | B22 | B21 | B01 | B14 | B11 | A18 | A30 | 蜂鸣器 | SDA | SCL | MPU6500 | ADD | INT | OLED | 舵机 | AO2 | VIN+ | AO1 | OUT | AD0 | AD1 | AD2 | UART3 | BO2 | BO1
